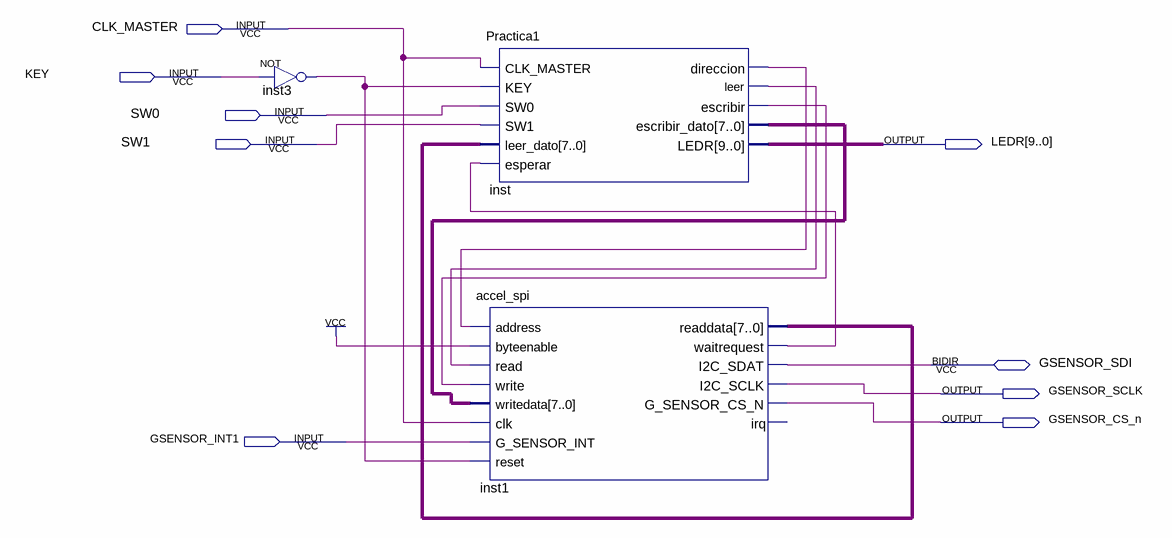
[diagram p0: schematic sheet]
// Quartus schematic Practica1Bloque.bdf as structural Verilog: 3 symbols, 9 pins
module Practica1Bloque (
  input  CLK_MASTER,
  input  KEY,
  input  SW0,
  input  SW1,
  input  GSENSOR_INT1,
  inout  GSENSOR_SDI,
  output [9:0] LEDR,
  output GSENSOR_SCLK,
  output GSENSOR_CS_n
);

  wire inst1_waitrequest, inst3_out, inst_direccion, inst_escribir, inst_leer;
  wire [7:0] inst1_readdata, inst_escribir_dato;

  not inst3 (inst3_out, KEY);
  Practica1 inst (
    .CLK_MASTER(CLK_MASTER), .KEY(inst3_out), .SW0(SW0), .SW1(SW1), .leer_dato(inst1_readdata),
    .esperar(inst1_waitrequest), .direccion(inst_direccion), .leer(inst_leer), .escribir(inst_escribir),
    .escribir_dato(inst_escribir_dato), .LEDR(LEDR));
  accel_spi inst1 (
    .address(inst_direccion), .byteenable(1'b1), .read(inst_leer), .write(inst_escribir),
    .writedata(inst_escribir_dato), .clk(CLK_MASTER), .G_SENSOR_INT(GSENSOR_INT1), .reset(inst3_out),
    .readdata(inst1_readdata), .waitrequest(inst1_waitrequest), .I2C_SCLK(GSENSOR_SCLK),
    .G_SENSOR_CS_N(GSENSOR_CS_n), .I2C_SDAT(GSENSOR_SDI));  // open: irq
endmodule
